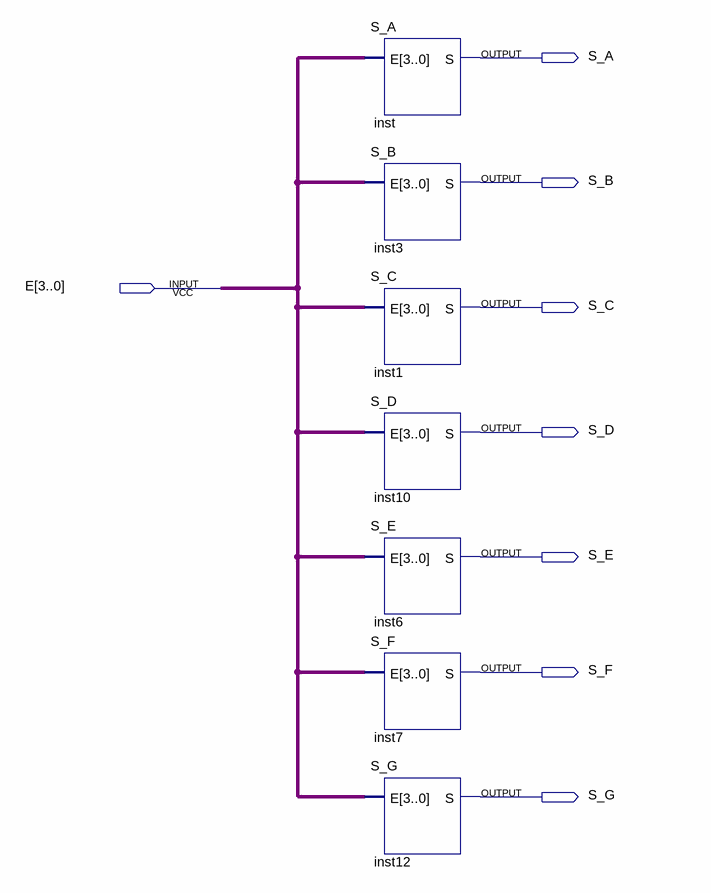
[diagram p0: schematic sheet]
// Quartus schematic Decodificador_Display_7.bdf as structural Verilog: 7 symbols, 8 pins
module Decodificador_Display_7 (
  input  [3:0] E,
  output S_A,
  output S_B,
  output S_C,
  output S_D,
  output S_E,
  output S_F,
  output S_G
);

  S_A inst (.E(E), .S(S_A));
  S_B inst3 (.E(E), .S(S_B));
  S_C inst1 (.E(E), .S(S_C));
  S_D inst10 (.E(E), .S(S_D));
  S_E inst6 (.E(E), .S(S_E));
  S_F inst7 (.E(E), .S(S_F));
  S_G inst12 (.E(E), .S(S_G));
endmodule
